# Altium project Kindle Page Turner RX.PrjPcb
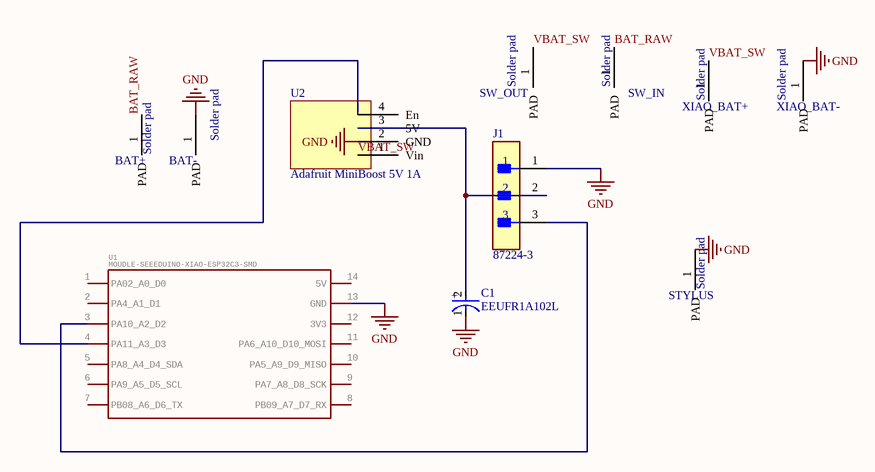
[diagram p0: Kindle_RX.SchDoc]
1 sheet, 11 parts. Net scope: global (net labels, ports and power ports of the same name join across sheets).
Board file: Kindle_RX.PcbDoc

## Sheet Kindle_RX.SchDoc
size A; SheetNumber: 1; SheetTotal: 1

### Parts
BAT+  Solder pad  [SOLDER_PAD_THT]
BAT-  Solder pad  [SOLDER_PAD_THT]
C1  EEUFR1A102L  [FP-RAD-TH-D_8_0_5-L_15_1-MFG]
J1  87224-3  [FP-87224-3-MFG]
STYLUS  Solder pad  [SOLDER_PAD_THT]
SW_IN  Solder pad  [SOLDER_PAD_THT]
SW_OUT  Solder pad  [SOLDER_PAD_THT]
U1  MOUDLE-SEEEDUINO-XIAO-ESP32C3-SMD  [MOUDLE14P-SMD-2.54-21X17.8MM]
U2  Adafruit MiniBoost 5V 1A  [PCBComponent_1]
XIAO_BAT+  Solder pad  [SOLDER_PAD_THT]
XIAO_BAT-  Solder pad  [SOLDER_PAD_THT]

### Nets
GND: BAT-.1(PAD) C1.1(C) J1.1 STYLUS.1(PAD) U1.13(GND) U2.2(GND) XIAO_BAT-.1(PAD)
BAT_RAW: BAT+.1(PAD) SW_IN.1(PAD)
VBAT_SW: SW_OUT.1(PAD) U2.1(Vin) XIAO_BAT+.1(PAD)
NetC1_2: C1.2(A) J1.2 U2.3(5V)
NetJ1_3: J1.3 U1.3(PA10_A2_D2)
NetU1_4: U1.4(PA11_A3_D3) U2.4(En)

Not connected (* = marked no-connect by the designer): U1 1(PA02_A0_D0) 2(PA4_A1_D1) 5(PA8_A4_D4_SDA) 6(PA9_A5_D5_SCL) 7(PB08_A6_D6_TX) 8(PB09_A7_D7_RX) 9(PA7_A8_D8_SCK) 10(PA5_A9_D9_MISO) 11(PA6_A10_D10_MOSI) 12(3V3) 14(5V)

### Notes on the sheet
- (in symbol CMP-05427-001033-1) +

### Library data of the parts
BAT+ BAT- STYLUS SW_IN SW_OUT XIAO_BAT+ XIAO_BAT- = SOLDER_PAD
C1 = CMP-05427-001033-1: Aluminum Electrolytic Capacitors (Radial Lead Type) 1000uF ±20% 10V; Ripple Current: 1.24A; Impedance: 41mR; Capacitance: 1mF; Lead Diameter: 0.6mm; Lead/Base Style: Straight; Life (Hours): 8000Hour; Dissipation Factor: 0.19%; Min Operating Temperature: -40°C; Height - Seated (Max): 0.65inch; Packaging: Bulk; Lead Pitch: 3.5mm; Max Operating Temperature: 105°C; Ripple Current (AC): 1.24A; ESR (Equivalent Series Resistance): 41mR; Construction: RADIAL; Voltage Rating: 10V; Voltage: 10V; Mount: Through Hole; Radiation Hardening: No; Termination: Radial; RoHS Compliant: Yes; Length: 15mm; REACH SVHC: No SVHC; Tolerance: 20%; Case/Package: Radial; Contact Plating: Tin; Height: 15mm; Series: FR; Diameter: 8mm; Voltage Rating (DC): 10V; Package Quantity: 200; Number of Pins: 2
J1 = CMP-2000-05697-2: CONN HEADER VERT 3POS 2.54MM; Number of Positions: 3; Gasket: No (Without); High Speed Serial Data Connector: No; Current Rating: 3A; Contact Post Length: 0.125inch; PCB Thickness: 1.397mm; PCB Mount Retention: Without; Connector Type: Plug; Approvals: CSA; PCB Mounting Orientation: Vertical; Pitch: 2.54mm; Mating Alignment: No (Without); Housing Color: Black; Contact Gender: Male; Length: 7.21mm; Max Operating Temperature: 105°C; Strain Relief: No (Without); Contact Material: Bronze; Row Spacing: 2.54mm; Series: AMPMODU MOD II; Board Standoff: No (Without); Package Quantity: 520; Radiation Hardening: No; Contact Protection: No (Without); Stabilizers: No (Without); Number of Rows: 1; Contact Mating Length: 8.08mm; Contact Shape: Square; Depth: 2.54mm; Contact Current Rating: 3A; Flammability Rating: UL94 V-0; Packaging: Carton; Number of Contacts: 3; Orientation: Straight; Mount: Through Hole; Keyed: No; Contact Type: Male Pin; Housing Material: Thermoplastic; High Temperature Housing: No; ELV: Compliant; Contact Plating: Gold; Termination: Through Hole; Selectively Loaded: No (Without); Lead Free: Lead Free; Min Operating Temperature: -65°C; Mating Connector Lock: No (Without); Color: Black; RoHS Compliant: Yes
U1 = MOUDLE-SEEEDUINO-XIAO-ESP32C3-SMD: GateName_1: G$1; DeviceName: -SMD; SymbolName_1: MOUDLE-SEEEDUINO-XIAO-ESP32C3; LibraryName: Seeed-Studio-XIAO-ESP32C3-footprint-eagle; DeviceSetName: MOUDLE-SEEEDUINO-XIAO-ESP32C3; Package: MOUDLE14P-SMD-2.54-21X17.8MM